# Altium project John_Main.PrjPcb (part 3 of 3)

## Sheet LED's Section_2.SchDoc
size A3; DocumentNumber: 5; SheetNumber: 5; SheetTotal: 7
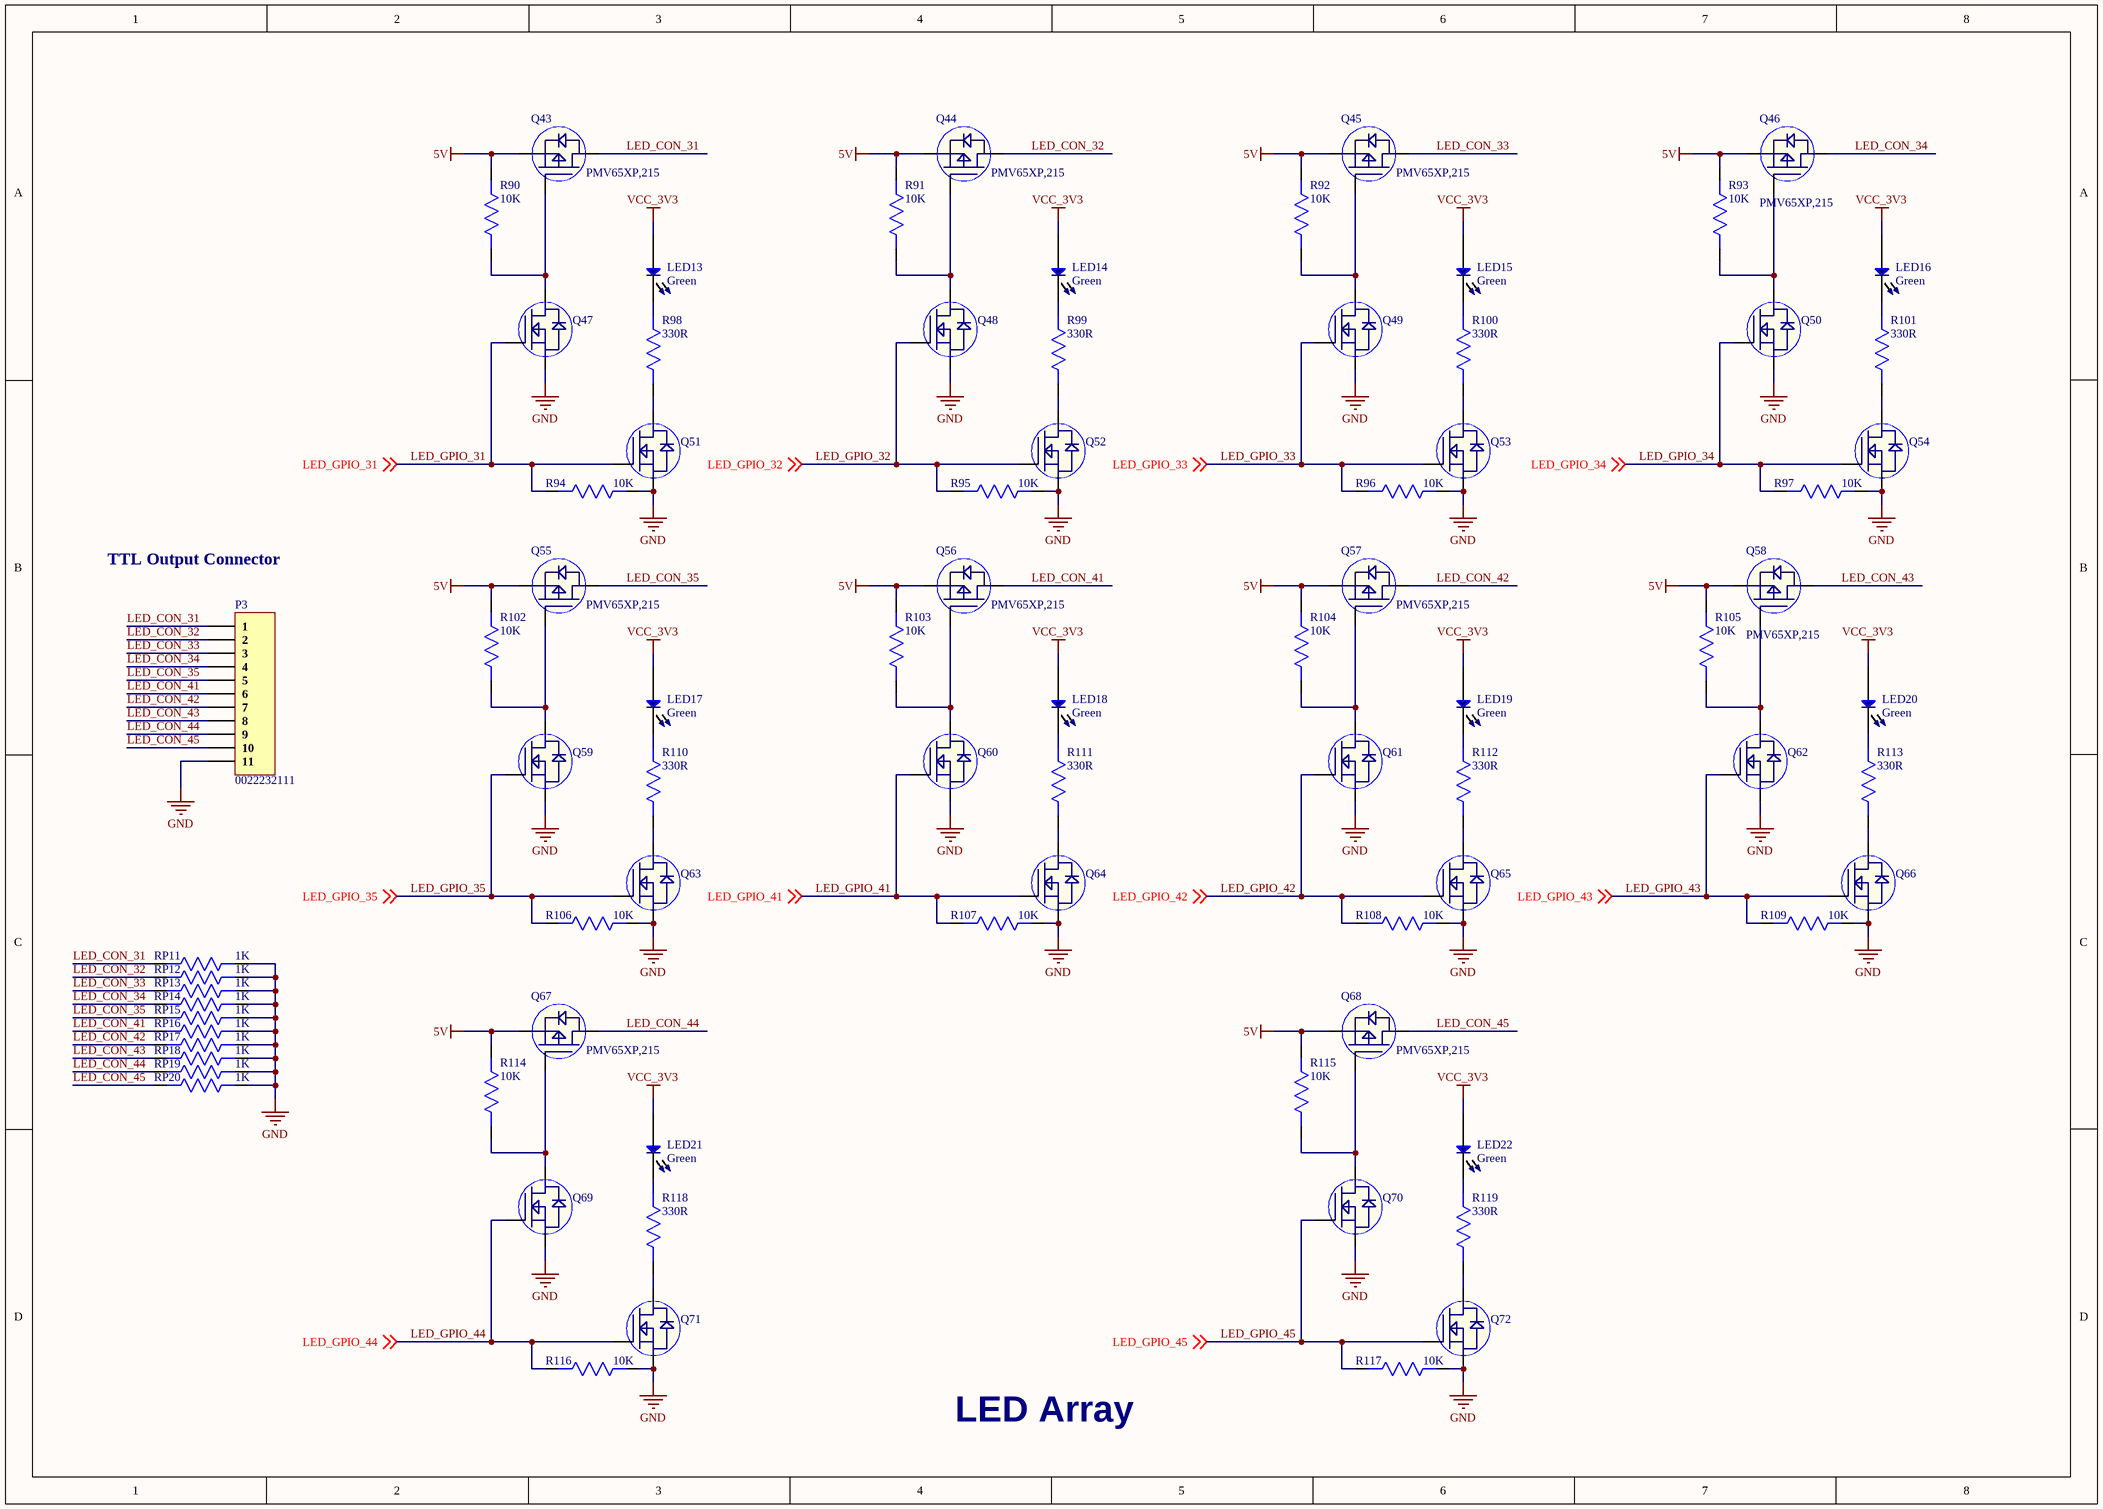
[diagram p4: LED's Section_2.SchDoc]

### Parts
LED13  Color: Green  [LED SMT]  (hidden comment: LTST-C190KGKT)
LED14  Color: Green  [LED SMT]  (hidden comment: LTST-C190KGKT)
LED15  Color: Green  [LED SMT]  (hidden comment: LTST-C190KGKT)
LED16  Color: Green  [LED SMT]  (hidden comment: LTST-C190KGKT)
LED17  Color: Green  [LED SMT]  (hidden comment: LTST-C190KGKT)
LED18  Color: Green  [LED SMT]  (hidden comment: LTST-C190KGKT)
LED19  Color: Green  [LED SMT]  (hidden comment: LTST-C190KGKT)
LED20  Color: Green  [LED SMT]  (hidden comment: LTST-C190KGKT)
LED21  Color: Green  [LED SMT]  (hidden comment: LTST-C190KGKT)
LED22  Color: Green  [LED SMT]  (hidden comment: LTST-C190KGKT)
P3  0022232111  [0022232111]
Q43  PMV65XP,215  [SOT23-3]
Q44  PMV65XP,215  [SOT23-3]
Q45  PMV65XP,215  [SOT23-3]
Q46  PMV65XP,215  [SOT23-3]
Q47  BSS138LT1G  [SOT23-3]  (value not drawn)
Q48  BSS138LT1G  [SOT23-3]  (value not drawn)
Q49  BSS138LT1G  [SOT23-3]  (value not drawn)
Q50  BSS138LT1G  [SOT23-3]  (value not drawn)
Q51  BSS138LT1G  [SOT23-3]  (value not drawn)
Q52  BSS138LT1G  [SOT23-3]  (value not drawn)
Q53  BSS138LT1G  [SOT23-3]  (value not drawn)
Q54  BSS138LT1G  [SOT23-3]  (value not drawn)
Q55  PMV65XP,215  [SOT23-3]
Q56  PMV65XP,215  [SOT23-3]
Q57  PMV65XP,215  [SOT23-3]
Q58  PMV65XP,215  [SOT23-3]
Q59  BSS138LT1G  [SOT23-3]  (value not drawn)
Q60  BSS138LT1G  [SOT23-3]  (value not drawn)
Q61  BSS138LT1G  [SOT23-3]  (value not drawn)
Q62  BSS138LT1G  [SOT23-3]  (value not drawn)
Q63  BSS138LT1G  [SOT23-3]  (value not drawn)
Q64  BSS138LT1G  [SOT23-3]  (value not drawn)
Q65  BSS138LT1G  [SOT23-3]  (value not drawn)
Q66  BSS138LT1G  [SOT23-3]  (value not drawn)
Q67  PMV65XP,215  [SOT23-3]
Q68  PMV65XP,215  [SOT23-3]
Q69  BSS138LT1G  [SOT23-3]  (value not drawn)
Q70  BSS138LT1G  [SOT23-3]  (value not drawn)
Q71  BSS138LT1G  [SOT23-3]  (value not drawn)
Q72  BSS138LT1G  [SOT23-3]  (value not drawn)
R90  10K  [Res0402]
R91  10K  [Res0402]
R92  10K  [Res0402]
R93  10K  [Res0402]
R94  10K  [Res0402]
R95  10K  [Res0402]
R96  10K  [Res0402]
R97  10K  [Res0402]
R98  330R  [Res0402]
R99  330R  [Res0402]
R100  330R  [Res0402]
R101  330R  [Res0402]
R102  10K  [Res0402]
R103  10K  [Res0402]
R104  10K  [Res0402]
R105  10K  [Res0402]
R106  10K  [Res0402]
R107  10K  [Res0402]
R108  10K  [Res0402]
R109  10K  [Res0402]
R110  330R  [Res0402]
R111  330R  [Res0402]
R112  330R  [Res0402]
R113  330R  [Res0402]
R114  10K  [Res0402]
R115  10K  [Res0402]
R116  10K  [Res0402]
R117  10K  [Res0402]
R118  330R  [Res0402]
R119  330R  [Res0402]
RP11  1K  [Res0402]
RP12  1K  [Res0402]
RP13  1K  [Res0402]
RP14  1K  [Res0402]
RP15  1K  [Res0402]
RP16  1K  [Res0402]
RP17  1K  [Res0402]
RP18  1K  [Res0402]
RP19  1K  [Res0402]
RP20  1K  [Res0402]

### Nets
5V: Q43.2(S) Q44.2(S) Q45.2(S) Q46.2(S) Q55.2(S) Q56.2(S) Q57.2(S) Q58.2(S) Q67.2(S) Q68.2(S) R90.2 R91.2 R92.2 R93.2 R102.2 R103.2 R104.2 R105.2 R114.2 R115.2
GND: P3.11 Q47.2(S) Q48.2(S) Q49.2(S) Q50.2(S) Q51.2(S) Q52.2(S) Q53.2(S) Q54.2(S) Q59.2(S) Q60.2(S) Q61.2(S) Q62.2(S) Q63.2(S) Q64.2(S) Q65.2(S) Q66.2(S) Q69.2(S) Q70.2(S) Q71.2(S) Q72.2(S) R94.2 R95.2 R96.2 R97.2 R106.2 R107.2 R108.2 R109.2 R116.2 R117.2 RP11.1 RP12.1 RP13.1 RP14.1 RP15.1 RP16.1 RP17.1 RP18.1 RP19.1 RP20.1
VCC_3V3: LED13.1 LED14.1 LED15.1 LED16.1 LED17.1 LED18.1 LED19.1 LED20.1 LED21.1 LED22.1
LED_CON_31: P3.1 Q43.3(D) RP11.2
LED_CON_32: P3.2 Q44.3(D) RP12.2
LED_CON_33: P3.3 Q45.3(D) RP13.2
LED_CON_34: P3.4 Q46.3(D) RP14.2
LED_CON_35: P3.5 Q55.3(D) RP15.2
LED_CON_41: P3.6 Q56.3(D) RP16.2
LED_CON_42: P3.7 Q57.3(D) RP17.2
LED_CON_43: P3.8 Q58.3(D) RP18.2
LED_CON_44: P3.9 Q67.3(D) RP19.2
LED_CON_45: P3.10 Q68.3(D) RP20.2
LED_GPIO_31: Q47.1(G) Q51.1(G) R94.1 ; off-sheet LED_GPIO_31
LED_GPIO_32: Q48.1(G) Q52.1(G) R95.1 ; off-sheet LED_GPIO_32
LED_GPIO_33: Q49.1(G) Q53.1(G) R96.1 ; off-sheet LED_GPIO_33
LED_GPIO_34: Q50.1(G) Q54.1(G) R97.1 ; off-sheet LED_GPIO_34
LED_GPIO_35: Q59.1(G) Q63.1(G) R106.1 ; off-sheet LED_GPIO_35
LED_GPIO_41: Q60.1(G) Q64.1(G) R107.1 ; off-sheet LED_GPIO_41
LED_GPIO_42: Q61.1(G) Q65.1(G) R108.1 ; off-sheet LED_GPIO_42
LED_GPIO_43: Q62.1(G) Q66.1(G) R109.1 ; off-sheet LED_GPIO_43
LED_GPIO_44: Q69.1(G) Q71.1(G) R116.1 ; off-sheet LED_GPIO_44
LED_GPIO_45: Q70.1(G) Q72.1(G) R117.1 ; off-sheet LED_GPIO_45
NetLED13_2: LED13.2 R98.1
NetLED14_2: LED14.2 R99.1
NetLED15_2: LED15.2 R100.1
NetLED16_2: LED16.2 R101.1
NetLED17_2: LED17.2 R110.1
NetLED18_2: LED18.2 R111.1
NetLED19_2: LED19.2 R112.1
NetLED20_2: LED20.2 R113.1
NetLED21_2: LED21.2 R118.1
NetLED22_2: LED22.2 R119.1
NetQ43_1: Q43.1(G) Q47.3(D) R90.1
NetQ44_1: Q44.1(G) Q48.3(D) R91.1
NetQ45_1: Q45.1(G) Q49.3(D) R92.1
NetQ46_1: Q46.1(G) Q50.3(D) R93.1
NetQ51_3: Q51.3(D) R98.2
NetQ52_3: Q52.3(D) R99.2
NetQ53_3: Q53.3(D) R100.2
NetQ54_3: Q54.3(D) R101.2
NetQ55_1: Q55.1(G) Q59.3(D) R102.1
NetQ56_1: Q56.1(G) Q60.3(D) R103.1
NetQ57_1: Q57.1(G) Q61.3(D) R104.1
NetQ58_1: Q58.1(G) Q62.3(D) R105.1
NetQ63_3: Q63.3(D) R110.2
NetQ64_3: Q64.3(D) R111.2
NetQ65_3: Q65.3(D) R112.2
NetQ66_3: Q66.3(D) R113.2
NetQ67_1: Q67.1(G) Q69.3(D) R114.1
NetQ68_1: Q68.1(G) Q70.3(D) R115.1
NetQ71_3: Q71.3(D) R118.2
NetQ72_3: Q72.3(D) R119.2

### Notes on the sheet
- TTL Output Connector
- LED Array

### Library data of the parts
LED13-LED22 = LTST-C190KGKT: LED GREEN CLEAR CHIP SMD; Manufacturer: Vishay Lite-On; Lens Color: Colorless; Lens Style: Diffused,Colorless,Rectangular,Clear; Forward Voltage: 2V; Luminous Intensity: 35mcd; Viewing Angle: 130°; Dominant Wavelength: 571nm; Test Current: 20mA; Wavelength: 574nm; Forward Current: 30mA; Power Rating: 75mW; Number of Elements: 1; Reverse Voltage: 5V; Supplier 1: Digi-Key; Manufacturer Part Number: LTST-C190KGKT; Stock 1: 1327387; Pricing 1: 1=0.26, 10=0.188, 25=0.138, 100=0.0987, 250=0.06712, 500=0.05922, 1000=0.04639 (USD); Mount: Surface Mount; Case/Package: 0603; Number of Pins: 2; Case Code (Metric): 1608; Case Code (Imperial): 0603; Min Operating Temperature: -55°C; Max Operating Temperature: 85°C; Packaging: Tape and Reel; Package Quantity: 1; Lens Transparency: Clear; Illumination Color: Green; Power Dissipation: 75mW; Number of LEDs: 1; Length: 1.6mm; Height: 0.8mm; Width: 0.8mm; Depth: 0.8mm; Radiation Hardening: No; Lead Free: Lead Free; ComponentLink1URL: https://www.verical.com/server-webapp/html/getDatasheet?partID=141494&src-supplier=Verical; ComponentLink1Description: https://www.verical.com/server-webapp/html/getDatasheet?partID=141494&src-supplier=Verical; ComponentLink2URL: http://optoelectronics.liteon.com/upload/download/DS22-2000-074/LTST-C190KGKT.PDF?src-supplier=Digi-Key; ComponentLink2Description: http://optoelectronics.liteon.com/upload/download/DS22-2000-074/LTST-C190KGKT.PDF?src-supplier=Digi-Key; ComponentLink3URL: http://www.mouser.com/ds/2/239/LTST-C190KGKT-1141861.pdf?src-supplier=Mouser; ComponentLink3Description: http://www.mouser.com/ds/2/239/LTST-C190KGKT-1141861.pdf?src-supplier=Mouser; ComponentLink4URL: http://uk.rs-online.com/webdocs/0dc0/0900766b80dc02a8.pdf?src-supplier=RSComponents; ComponentLink4Description: http://uk.rs-online.com/webdocs/0dc0/0900766b80dc02a8.pdf?src-supplier=RSComponents; Supplier Part Number 1: 160-1435-6-ND
P3 = 0022232111: CONN HEADER VERT 11POS 2.54MM; Manufacturer: Molex; Contact Resistance: 10mR; Number of Contacts: 11; Gender: Male; Supplier 1: Digi-Key; Manufacturer Part Number: 0022232111; Stock 1: 1529; Pricing 1: 1=0.74, 10=0.652, 100=0.5628, 500=0.46046, 1000=0.4093, 5000=0.35813, 10000=0.34023 (USD); Contact Plating: Copper,Tin; Contact Material: Brass; Housing Color: White; Housing Material: Nylon; Min Operating Temperature: 0°C; Max Operating Temperature: 75°C; Number of Rows: 1; Packaging: Bag; Termination: Solder; Orientation: Straight; Length: 27.94mm; Pitch: 2.54mm; Depth: 6.35mm; ComponentLink1URL: http://components.arrow.com/part/dataview/4703620S3674830N3303?src-supplier=Arrow; ComponentLink1Description: http://components.arrow.com/part/dataview/4703620S3674830N3303?src-supplier=Arrow; Supplier Part Number 1: 23-0022232111-ND
Q43-Q46 Q55-Q58 Q67 Q68 = PMV65XP,215: MOSFET P-CH 20V 2.8A SOT-23; Manufacturer: Nexperia; Supplier 1: Digi-Key; Manufacturer Part Number: PMV65XP,215; Stock 1: 60287; Pricing 1: 1=0.38, 10=0.28, 25=0.2452, 100=0.133, 250=0.13232, 500=0.1085, 1000=0.0805 (USD); Supplier Part Number 1: 1727-3124-1-ND
Q47-Q54 Q59-Q66 Q69-Q72 = BSS138LT1G: MOSFET N-CH 50V 200MA SOT-23; Manufacturer: ON Semiconductor; Gate to Source Voltage (Vgs): 20V; Nominal Vgs: 1.5V; Rds On Max: 3.5R; Input Capacitance: 50pF; Number of Elements: 1; Max Power Dissipation: 225mW; Turn-Off Delay Time: 20ns; Element Configuration: Single; ComponentLink1URL: https://datasheet.ciiva.com/22641/1596366-22641636.pdf; ComponentLink1Description: https://datasheet.ciiva.com/22641/1596366-22641636.pdf; ComponentLink2URL: https://datasheet.ciiva.com/1190/1596366-1190137.pdf; ComponentLink2Description: https://datasheet.ciiva.com/1190/1596366-1190137.pdf; ComponentLink3URL: https://datasheet.ciiva.com/15198/getdatasheetpartid-110266-15198908.pdf; ComponentLink3Description: https://datasheet.ciiva.com/15198/getdatasheetpartid-110266-15198908.pdf; ComponentLink4URL: https://datasheet.ciiva.com/8115/bss138lt1-d-8115295.pdf; ComponentLink4Description: https://datasheet.ciiva.com/8115/bss138lt1-d-8115295.pdf; ComponentLink5URL: https://datasheet.ciiva.com/8115/bss138lt1-d-8115358.pdf; ComponentLink5Description: https://datasheet.ciiva.com/8115/bss138lt1-d-8115358.pdf; ComponentLink6URL: https://datasheet.ciiva.com/1190/1596366-1190136.pdf; ComponentLink6Description: https://datasheet.ciiva.com/1190/1596366-1190136.pdf; ComponentLink7URL: https://datasheet.ciiva.com/936/bss138lt1-d-936802.pdf; ComponentLink7Description: https://datasheet.ciiva.com/936/bss138lt1-d-936802.pdf; ComponentLink8URL: https://datasheet.ciiva.com/936/bss138lt1-d-936801.pdf; ComponentLink8Description: https://datasheet.ciiva.com/936/bss138lt1-d-936801.pdf; ComponentLink9URL: https://datasheet.ciiva.com/14553/70099493-14553829.pdf; ComponentLink9Description: https://datasheet.ciiva.com/14553/70099493-14553829.pdf; ComponentLink10URL: https://datasheet.ciiva.com/936/bss138lt1-d-936803.pdf; ComponentLink10Description: https://datasheet.ciiva.com/936/bss138lt1-d-936803.pdf; Supplier 1: Digi-Key; Manufacturer Part Number: BSS138LT1G; Stock 1: 1283212; Pricing 1: 1=0.27, 10=0.222, 100=0.1177, 500=0.07746, 1000=0.05267 (USD); Case/Package: SOT-23-3; Number of Pins: 3; Contact Plating: Tin,Matte; Min Operating Temperature: -55°C; Max Operating Temperature: 150°C; Continuous Drain Current (ID): 200mA; Package Quantity: 1; Packaging: Tape and Reel; Drain to Source Breakdown Voltage: 50V; Power Dissipation: 225mW; Drain to Source Resistance: 3.5R; Threshold Voltage: 1.5V; Turn-On Delay Time: 20ns; Voltage Rating (DC): 50V; Current Rating: 200mA; On-State Resistance: 3.5R; Length: 3.04mm; Height: 1.01mm; Width: 1.4mm; Radiation Hardening: No; REACH SVHC: No SVHC; Lead Free: Lead Free; Halogen Free: Halogen Free; ComponentLink11URL: http://www.onsemi.com/pub/Collateral/BSS138LT1-D.PDF?src-supplier=Digi-Key; ComponentLink11Description: http://www.onsemi.com/pub/Collateral/BSS138LT1-D.PDF?src-supplier=Digi-Key; ComponentLink12URL: http://www.farnell.com/datasheets/1596366.pdf?src-supplier=Element14; ComponentLink12Description: http://www.farnell.com/datasheets/1596366.pdf?src-supplier=Element14; ComponentLink13URL: http://www.alliedelec.com/m/d/b3c6fd7d92596813fe75d33dcbaaae90.pdf?src-supplier=Allied+Electronics; ComponentLink13Description: http://www.alliedelec.com/m/d/b3c6fd7d92596813fe75d33dcbaaae90.pdf?src-supplier=Allied+Electronics; ComponentLink14URL: https://www.verical.com/server-webapp/html/getDatasheet?partID=110266&src-supplier=Verical; ComponentLink14Description: https://www.verical.com/server-webapp/html/getDatasheet?partID=110266&src-supplier=Verical; ComponentLink15URL: http://www.onsemi.com/pub_link/Collateral/BSS138LT1-D.PDF?src-supplier=Avnet; ComponentLink15Description: http://www.onsemi.com/pub_link/Collateral/BSS138LT1-D.PDF?src-supplier=Avnet; Supplier Part Number 1: BSS138LT1GOSDKR-ND
R90-R97 R102-R109 R114-R117 = RC0402FR-0710KL: RES SMD 10K OHM 1% 1/16W 0402; Manufacturer: Yageo Phycomp; Temperature Coefficient: 100ppm/°C; Resistance: 10000R; Voltage Rating (DC): 50V; Power Rating: 63mW; Supplier 1: Digi-Key; Manufacturer Part Number: RC0402FR-0710KL; Stock 1: 98435877; Pricing 1: 1=0.1, 10=0.016, 100=0.0067, 1000=0.00301, 2500=0.00261, 5000=0.00215 (USD); Mount: Surface Mount; Case/Package: 0402; Number of Pins: 2; Min Operating Temperature: -55°C; Max Operating Temperature: 155°C; Tolerance: 1%; Packaging: Cut Tape; Length: 1mm; Height: 0.32mm; Width: 500um; Depth: 0.5mm; REACH SVHC: No SVHC; Lead Free: Lead Free; Supplier Part Number 1: 311-10.0KLRCT-ND
R98-R101 R110-R113 R118 R119 = RC0402FR-07330RL: RES SMD 330 OHM 1% 1/16W 0402; Manufacturer: Yageo; Power Rating: 62.5mW; Voltage Rating: 50V; Temperature Coefficient: 100ppm/°C; Max Power Dissipation: 63mW; ComponentLink1URL: http://www.farnell.com/datasheets/1784430.pdf?src-supplier=Element14; ComponentLink1Description: http://www.farnell.com/datasheets/1784430.pdf?src-supplier=Element14; ComponentLink2URL: http://www.yageo.com/documents/recent/PYu-RC_Group_51_RoHS_L_9.pdf?src-supplier=Mouser; ComponentLink2Description: http://www.yageo.com/documents/recent/PYu-RC_Group_51_RoHS_L_9.pdf?src-supplier=Mouser; ComponentLink3URL: http://www.yageo.com/documents/recent/PYu-RC0402_51_RoHS_L_6_r.pdf?src-supplier=Future+Electronics; ComponentLink3Description: http://www.yageo.com/documents/recent/PYu-RC0402_51_RoHS_L_6_r.pdf?src-supplier=Future+Electronics; ComponentLink4URL: https://www.verical.com/server-webapp/html/getDatasheet?partID=329466&src-supplier=Verical; ComponentLink4Description: https://www.verical.com/server-webapp/html/getDatasheet?partID=329466&src-supplier=Verical; ComponentLink5URL: http://www.farnell.com/datasheets/1018594.pdf?src-supplier=Element14; ComponentLink5Description: http://www.farnell.com/datasheets/1018594.pdf?src-supplier=Element14; ComponentLink6URL: http://www.farnell.com/datasheets/2167052.pdf?src-supplier=Element14; ComponentLink6Description: http://www.farnell.com/datasheets/2167052.pdf?src-supplier=Element14; ComponentLink7URL: http://documents.rs-components.com/techlib://itc_doclist_GB.htm?stockno=6185810&src-supplier=RSComponents; ComponentLink7Description: http://documents.rs-components.com/techlib://itc_doclist_GB.htm?stockno=6185810&src-supplier=RSComponents; Supplier 1: Digi-Key; Manufacturer Part Number: RC0402FR-07330RL; Stock 1: 6258760; Pricing 1: 1=0.1, 10=0.016, 100=0.0067, 1000=0.003, 2500=0.0026, 5000=0.0022 (USD); Case/Package: 0402; Case Code (Metric): 1005; Case Code (Imperial): 0402; Min Operating Temperature: -55°C; Max Operating Temperature: 155°C; Packaging: Tape and Reel; Resistance: 330R; Tolerance: 1%; Composition: Thick Film; Termination: SMD/SMT; Military Standard: Not; Package Quantity: 1; Number of Terminations: 2; Features: Moisture Resistant; Length: 0.039inch; Height: 0.016inch; Depth: 0.5mm; Width: 0.02inch; REACH SVHC: Unknown; Lead Free: Lead Free; ComponentLink8URL: http://www.yageo.com/documents/recent/PYu-RC_Group_51_RoHS_L_10.pdf?src-supplier=Digi-Key; ComponentLink8Description: http://www.yageo.com/documents/recent/PYu-RC_Group_51_RoHS_L_10.pdf?src-supplier=Digi-Key; ComponentLink9URL: http://www.mouser.com/ds/2/447/PYu-RC0402_51_RoHS_L_6_r-8721.pdf?src-supplier=Mouser; ComponentLink9Description: http://www.mouser.com/ds/2/447/PYu-RC0402_51_RoHS_L_6_r-8721.pdf?src-supplier=Mouser; Supplier Part Number 1: 311-330LRCT-ND
RP11-RP20 = AT0402FRE071KL: RES SMD 1K OHM 1% 1/16W 0402; Manufacturer: Yageo; Resistance: 1kR; Max Power Dissipation: 63mW; Temperature Coefficient: 50ppm/°C; Supplier 1: Digi-Key; Manufacturer Part Number: AT0402FRE071KL; RoHS: Yes; Category: Chip SMD Resistors; Stock 1: 559; Pricing 1: 1=0.14000, 10=0.11800, 100=0.04620, 1000=0.01935, 2500=0.01774, 5000=0.01612 (USD); Case/Package: 0402; Case Code (Metric): 1005; Case Code (Imperial): 0402; Min Operating Temperature: -55°C; Max Operating Temperature: 155°C; Packaging: Tape and Reel; Resistor Type: Thin Film; Number of Terminations: 2; Tolerance: 1%; Features: Moisture Resistant,Automotive AEC-Q200,Anti-Sulfur; Length: 0.039inch; Width: 0.02inch; Height: 0.014inch; RoHS Compliant: Yes; ComponentLink1URL: http://www.yageo.com/documents/recent/PYu-AT_51_RoHS_L-3.pdf?src-supplier=Digi-Key; ComponentLink1Description: http://www.yageo.com/documents/recent/PYu-AT_51_RoHS_L-3.pdf?src-supplier=Digi-Key; ComponentLink2URL: http://www.yageo.com/documents/recent/PYu-AT_51_RoHS_L_5.pdf?src-supplier=Digi-Key; ComponentLink2Description: http://www.yageo.com/documents/recent/PYu-AT_51_RoHS_L_5.pdf?src-supplier=Digi-Key; Supplier Part Number 1: YAG2105CT-ND

## Sheet USB Section.SchDoc: *USB Section
size A4; DocumentNumber: 3; SheetNumber: 3; SheetTotal: 7
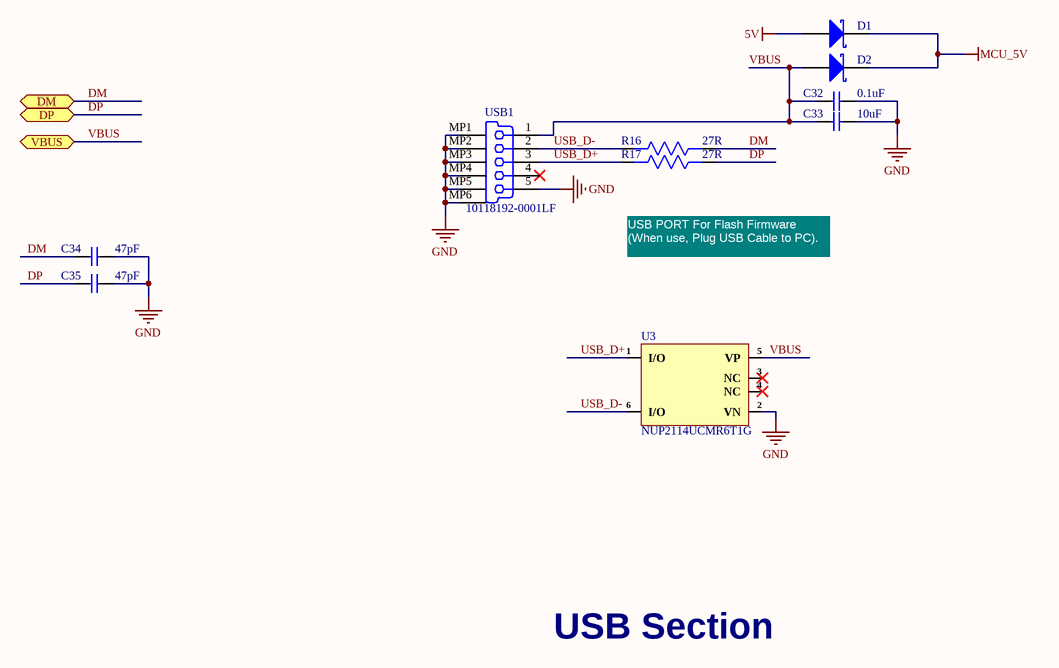
[diagram p5: USB Section.SchDoc]

### Parts
C32  0.1uF  [Cap0402]
C33  10uF  [Cap0402]
C34  47pF  [Cap0402]
C35  47pF  [Cap0402]
D1  PMEG3010ER,115  [SOD123W]  (value not drawn)
D2  PMEG3010ER,115  [SOD123W]  (value not drawn)
R16  27R  [Res0402]
R17  27R  [Res0402]
U3  NUP2114UCMR6T1G  [6-TSOP]
USB1  10118192-0001LF  [Micro Usb Conn SMD]

### Ports
DM (bidir), DP (bidir), VBUS (bidir)

### Nets
5V: D1.A
GND: C32.2 C33.2 C34.2 C35.2 U3.2(VN) USB1.5(GND) USB1.MP1(Tab) USB1.MP2(Tab) USB1.MP3(Tab) USB1.MP4(Tab) USB1.MP5(Tab) USB1.MP6(Tab)
MCU_5V: D1.K D2.K
VBUS: C32.1 C33.1 D2.A U3.5(VP) USB1.1(V_BUS_(5V)) ; port VBUS
DM: C34.1 R16.1 ; port DM
DP: C35.1 R17.1 ; port DP
USB_D+: R17.2 U3.1(I/O) USB1.3(D+)
USB_D-: R16.2 U3.6(I/O) USB1.2(D-)

Not connected (* = marked no-connect by the designer): U3 3(NC)* 4(NC)*; USB1 4(NC)*

### Notes on the sheet
- USB PORT For Flash Firmware
  (When use, Plug USB Cable to PC).
- USB Section

### Library data of the parts
C32 = CC0402KRX5R7BB104: CAP CER 0.1UF 16V X5R 0402; Manufacturer: Yageo; Capacitance: 100nF; Tolerance: 10%; Supplier 1: Digi-Key; Manufacturer Part Number: CC0402KRX5R7BB104; Stock 1: 2577166; Pricing 1: 1=0.1, 10=0.03, 100=0.0135, 500=0.0096, 1000=0.0076, 2500=0.0069, 5000=0.0063 (USD); Mount: Surface Mount; Case/Package: 0402; Number of Pins: 2; Case Code (Metric): 1005; Case Code (Imperial): 0402; Min Operating Temperature: -55°C; Max Operating Temperature: 85°C; Packaging: Tape and Reel; Voltage Rating: 16V; Package Quantity: 1; Voltage Rating (DC): 16V; Dielectric: X5R; Termination: SMD/SMT; Composition: Ceramic; Length: 1mm; Height: 0.5mm; Width: 0.02inch; Thickness: 0.022inch; Depth: 0.5mm; Radiation Hardening: No; REACH SVHC: Unknown; Lead Free: Lead Free; Halogen Free: Halogen Free; ComponentLink1URL: http://www.yageo.com/documents/recent/UPY-GPHC_X5R_4V-to-50V_12.pdf?src-supplier=Avnet; ComponentLink1Description: http://www.yageo.com/documents/recent/UPY-GPHC_X5R_4V-to-50V_12.pdf?src-supplier=Avnet; ComponentLink2URL: http://www.yageo.com/documents/recent/UPY-GPHC_X5R_4V-to-50V_25.pdf?src-supplier=Digi-Key; ComponentLink2Description: http://www.yageo.com/documents/recent/UPY-GPHC_X5R_4V-to-50V_25.pdf?src-supplier=Digi-Key; ComponentLink3URL: http://www.yageo.com/exep/pages/download/literatures/ProductSelectionGuide%202014_Final_2.pdf?src-supplier=Digi-Key; ComponentLink3Description: http://www.yageo.com/exep/pages/download/literatures/ProductSelectionGuide%202014_Final_2.pdf?src-supplier=Digi-Key; ComponentLink4URL: http://www.yageo.com/documents/recent/UPY-GPHC_X5R_4V-to-50V_12.pdf?src-supplier=Avnet+Europe; ComponentLink4Description: http://www.yageo.com/documents/recent/UPY-GPHC_X5R_4V-to-50V_12.pdf?src-supplier=Avnet+Europe; Supplier Part Number 1: 311-1347-1-ND
C33 = CL05A106MP8NUB8: CAP CER 10UF 10V X5R 0402; Manufacturer: Samsung; Tolerance: 20%; Supplier 1: Digi-Key; Manufacturer Part Number: CL05A106MP8NUB8; Stock 1: 1158256; Pricing 1: 1=0.45, 10=0.311, 100=0.1863, 500=0.13972, 1000=0.11799, 2500=0.11178 (USD); Mount: Surface Mount; Case/Package: 0402; Case Code (Metric): 1005; Case Code (Imperial): 0402; Min Operating Temperature: -55°C; Max Operating Temperature: 85°C; Packaging: Tape and Reel; Capacitance: 10uF; Voltage Rating: 10V; Length: 0.039inch; Width: 0.02inch; Thickness: 0.035inch; Supplier Part Number 1: 1276-6830-1-ND
C34 C35 = GCM1555C1H470JA16D: CAP CER 47PF 50V C0G/NP0 0402; Manufacturer: Murata; Tolerance: 5%; Supplier 1: Digi-Key; Manufacturer Part Number 1: GCM1555C1H470JA16D; Stock 1: 524245; Pricing 1: 1=0.1, 10=0.068, 100=0.0303, 500=0.0217, 1000=0.017, 2500=0.0155, 5000=0.0142 (USD); Mount: Surface Mount; Case/Package: 0402; Case Code (Metric): 1005; Case Code (Imperial): 0402; Min Operating Temperature: -55°C; Max Operating Temperature: 125°C; Packaging: Cut Tape; Capacitance: 47pF; Voltage Rating: 50V; Length: 0.039inch; Width: 0.02inch; Thickness: 0.022inch; Ratings: AEC-Q200; Lead Free: Lead Free; Supplier Part Number 1: 490-10670-1-ND
D1 D2 = PMEG3010ER,115: DIODE SCHOTTKY 30V 1A SOD123W; Manufacturer: Nexperia; Supplier 1: Digi-Key; Manufacturer Part Number: PMEG3010ER,115; Stock 1: 75070; Pricing 1: 1=0.36, 10=0.29, 100=0.1669, 500=0.1545, 1000=0.10506 (USD); Supplier Part Number 1: 1727-5201-1-ND
R16 R17 = RT0402FRE0727RL: RES SMD 27 OHM 1% 1/16W 0402; Manufacturer: Yageo; Power Rating: 62.5mW; Voltage Rating: 50V; Max Power Dissipation: 63mW; Temperature Coefficient: 50ppm/°C; Supplier 1: Digi-Key; Manufacturer Part Number 1: RT0402FRE0727RL; Stock 1: 26946; Pricing 1: 1=0.1, 10=0.072, 100=0.0277, 1000=0.0122, 2500=0.0105, 5000=0.0094 (USD); Case/Package: 0402; Case Code (Metric): 1005; Case Code (Imperial): 0402; Min Operating Temperature: -55°C; Max Operating Temperature: 125°C; Resistance: 27R; Tolerance: 1%; Packaging: Tape and Reel; Package Quantity: 10000; Composition: Thin Film; Number of Terminations: 2; Termination: SMD/SMT; Military Standard: Not; Voltage Rating (DC): 50V; Features: Moisture Resistant; Length: 1mm; Height: 0.014inch; Width: 0.02inch; Depth: 0.5mm; Lead Free: Lead Free; ComponentLink1URL: http://www.yageo.com/NewPortal/yageodocoutput?fileName=/pdf/R-Chip/PYu-RT_1-to-0.05_RoHS_L_5.pdf&src-supplier=Digi-Key; ComponentLink1Description: http://www.yageo.com/NewPortal/yageodocoutput?fileName=/pdf/R-Chip/PYu-RT_1-to-0.05_RoHS_L_5.pdf&src-supplier=Digi-Key; ComponentLink2URL: http://www.mouser.com/ds/2/447/yageodocoutput-1125656.pdf?src-supplier=Mouser; ComponentLink2Description: http://www.mouser.com/ds/2/447/yageodocoutput-1125656.pdf?src-supplier=Mouser; Supplier Part Number 1: YAG3343CT-ND
U3 = NUP2114UCMR6T1G: TVS DIODE 5VWM 10VC 6TSOP; Manufacturer: onsemi; Manufacturer Lifecycle Status: ACTIVE; Item Type: TVS Diodes; Breakdown Voltage: 7.5V; Value: 1pF; Clamping Voltage: 12V; Direction: Unidirectional; Element Configuration: Single; ESD Protection: Yes; Leakage Current: 1µA; Max Surge Current: 19A; Min Breakdown Voltage: 6V; Number of Bidirectional Channels: 2; Number of Channels: 1; Operating Supply Voltage: 5V; Peak Pulse Current: 8A; Test Current: 1mA; Supplier: DigiKey; LCSC Part Number: C393373; Manufacturer Part Number: NUP2114UCMR6T1G; RoHS: Compliant; Stock: 34630; Pricing: 1=0.81, 10=0.5, 100=0.3234, 500=0.24708, 1000=0.22246 (USD); Case/Package: TSOP; China RoHS: Compliant; Contact Plating: Tin; Depth: 1.5mm; Halogen Free: Halogen Free; Height: 1mm; Lead Free: Lead Free; Length: 3mm; Lifecycle Status: Production; Max Breakdown Voltage: 7.5V; Max Operating Temperature: 125°C; Max Reverse Leakage Current: 1µA; Min Operating Temperature: -40°C; Number of Elements: 1; Number of Lines: 2; Pins: 6; Number of Terminals: 6; Packaging: Tape and Reel; Peak Reverse Current: 1µA; Polarity: Unidirectional; Power Line Protection: Yes; Radiation Hardening: No; REACH SVHC: Yes; Reverse Standoff Voltage: 5V; Schedule B: 8536300000, 8536300000|8536300000|8536300000|8536300000|8536300000|8536300000|8536300000|8536300000|8536300000|8536300000|8536300000|8536300000|8536300000|8536300000|8536300000|8536300000|8536300000|8536300000|8536300000|8536300000|8536300000|8536300000|8536300000|85; Width: 1.7mm; Working Voltage: 5V; ComponentLink1URL: https://datasheet.octopart.com:443/NUP2114UCMR6T1G-onsemi-datasheet-180968601.pdf?src-supplier=IHS; ComponentLink1Description: https://datasheet.octopart.com:443/NUP2114UCMR6T1G-onsemi-datasheet-180968601.pdf?src-supplier=IHS; ComponentLink2URL: https://datasheet.octopart.com:443/NUP2114UCMR6T1G-ON-Semiconductor-datasheet-139013348.pdf?src-supplier=Upverter; ComponentLink2Description: https://datasheet.octopart.com:443/NUP2114UCMR6T1G-ON-Semiconductor-datasheet-139013348.pdf?src-supplier=Upverter; ComponentLink3URL: https://datasheet.octopart.com:443/NUP2114UCMR6T1G-ON-Semiconductor-datasheet-12517220.pdf?src-supplier=JRH+Electronics; ComponentLink3Description: https://datasheet.octopart.com:443/NUP2114UCMR6T1G-ON-Semiconductor-datasheet-12517220.pdf?src-supplier=JRH+Electronics; ComponentLink4URL: https://datasheet.octopart.com:443/NUP2114UCMR6T1G-ON-Semiconductor-datasheet-93402670.pdf?src-supplier=Newark; ComponentLink4Description: https://datasheet.octopart.com:443/NUP2114UCMR6T1G-ON-Semiconductor-datasheet-93402670.pdf?src-supplier=Newark; ComponentLink5URL: https://datasheet.octopart.com:443/NUP2114UCMR6T1G-ON-Semiconductor-datasheet-11781058.pdf?src-supplier=Arrow+Electronics; ComponentLink5Description: https://datasheet.octopart.com:443/NUP2114UCMR6T1G-ON-Semiconductor-datasheet-11781058.pdf?src-supplier=Arrow+Electronics; ComponentLink6URL: http://sigma.octopart.com:80/15540786/rohs_certificate/ON-Semiconductor-NUP2114UCMR6T1G.pdf?src-supplier=Compliance+Statements; ComponentLink6Description: http://sigma.octopart.com:80/15540786/rohs_certificate/ON-Semiconductor-NUP2114UCMR6T1G.pdf?src-supplier=Compliance+Statements; ComponentLink7URL: http://sigma.octopart.com:80/15684254/materials_sheet/ON-Semiconductor-NUP2114UCMR6T1G.csv?src-supplier=Compliance+Statements; ComponentLink7Description: http://sigma.octopart.com:80/15684254/materials_sheet/ON-Semiconductor-NUP2114UCMR6T1G.csv?src-supplier=Compliance+Statements; ComponentLink8URL: http://sigma.octopart.com:80/150629776/rohs_statement/ON-Semiconductor-NUP2114UCMR6T1G.pdf?src-supplier=Compliance+Statements; ComponentLink8Description: http://sigma.octopart.com:80/150629776/rohs_statement/ON-Semiconductor-NUP2114UCMR6T1G.pdf?src-supplier=Compliance+Statements; ComponentLink9URL: http://sigma.octopart.com:80/reach_statement/ON-Semiconductor-company-79.pdf?src-supplier=Compliance+Statements; ComponentLink9Description: http://sigma.octopart.com:80/reach_statement/ON-Semiconductor-company-79.pdf?src-supplier=Compliance+Statements; ComponentLink10URL: https://octopart.com:443/opatz8j6/c1?t=WHQR9uYdgpzj_1pscu76jQl6SgdNYEFCsB45f32wZZoFxCsQNnTKjjNsMYmP8-tNAzH3PllWfDzCrm21sm3O0yX6Z-53NNC5eFJr5XbJGHdORXd5PF3OOo3CImUBKNeQS3HmN9uPOWjBWXFdunIc45LQOJ5gn3633PacQX-_VlsFFggQuFkNQdU_reWhDfM_aJjhbu9NdAkiBle4rEQKmYnaoI-ZpXvRqCCi0hGZ9pE0dY1iMvStjDVJm3RbKYgavDmI8RSqtgWwHOO5VIrlYvErgV0U4ccu7WiifKCK2DwQWrnPYcBzCgFR9XOWz9r3-48fB14U1Lqb5JaFbo5XHNFFjMaufSDK6ZmMxG1n87oH0pc&src-supplier=Compliance+Statements; ComponentLink10Description: https://octopart.com:443/opatz8j6/c1?t=WHQR9uYdgpzj_1pscu76jQl6SgdNYEFCsB45f32wZZoFxCsQNnTKjjNsMYmP8-tNAzH3PllWfDzCrm21sm3O0yX6Z-53NNC5eFJr5XbJGHdORXd5PF3OOo3CImUBKNeQS3HmN9uPOWjBWXFdunIc45LQOJ5gn3633PacQX-_VlsFFggQuFkNQdU_reWhDfM_aJjhbu9NdAkiBle4rEQKmYnaoI-ZpXvRqCCi0hGZ9pE0dY1iMvStjDVJm3RbKYgavDmI8RSqtgWwHOO5VIrlYvErgV0U4ccu7WiifKCK2DwQWrnPYcBzCgFR9XOWz9r3-48fB14U1Lqb5JaFbo5XHNFFjMaufSDK6ZmMxG1n87oH0pc&src-supplier=Compliance+Statements; ComponentLink11URL: https://octopart.com:443/opatz8j6/c1?t=VqVTyc6VXqTBoXsnuoG7LjY3mp2KX-eKzPIkg7aySNunBFpm0IQnkmc826qVFZhglS6vaf-VvqwaWaROfS_iErSVq9YUUuVgokCDv5Vhxq2pu1cn-vrRw1TlcFDaGbodQB-atNY6UP6gD2sOO8NRAoQTemD37mLChF1Rt1bpz95WWhJ_wI0XqbdDN8V1Apvbq8ufNLXwMMdHk5jYglIDCz4WpJf5DoTt1BP_MBv-tXAye_NcKa095654jMt3sjm_6RuC2vVrkcCpfXNjjgvjYPsYUvKBiXeM6Xjzw9honyCE0JlgCVT7WXyyf_6oP9kIrOXlSICGvfIO1US9YbBHujA-CLkGpoYI906K6Xw-TlpUog&src-supplier=Compliance+Statements; ComponentLink11Description: https://octopart.com:443/opatz8j6/c1?t=VqVTyc6VXqTBoXsnuoG7LjY3mp2KX-eKzPIkg7aySNunBFpm0IQnkmc826qVFZhglS6vaf-VvqwaWaROfS_iErSVq9YUUuVgokCDv5Vhxq2pu1cn-vrRw1TlcFDaGbodQB-atNY6UP6gD2sOO8NRAoQTemD37mLChF1Rt1bpz95WWhJ_wI0XqbdDN8V1Apvbq8ufNLXwMMdHk5jYglIDCz4WpJf5DoTt1BP_MBv-tXAye_NcKa095654jMt3sjm_6RuC2vVrkcCpfXNjjgvjYPsYUvKBiXeM6Xjzw9honyCE0JlgCVT7WXyyf_6oP9kIrOXlSICGvfIO1US9YbBHujA-CLkGpoYI906K6Xw-TlpUog&src-supplier=Compliance+Statements
USB1 = Micro Usb Conn SMD: CONN USB MICRO B RECPT SMT R/A; Manufacturer: Amphenol FCI; Gender: Receptacle; Current Rating: 1.8A; Connector Type: USB,Receptacle; Number of Contacts: 5; Insulation Resistance: 1GR; Number of Ports: 1; Max Voltage Rating (AC): 100V; USB Standard: USB 2.0; Pitch: 0.65mm; Supplier 1: Digi-Key; Manufacturer Part Number: 10118192-0001LF; Stock 1: 203283; Pricing 1: 1=0.42, 10=0.393, 25=0.3536, 50=0.3144, 100=0.3013, 250=0.2751, 500=0.262 (USD); Mount: Surface Mount,Horizontal; Contact Material: Copper Alloy; Contact Plating: Nickel,Gold; Colour: Black; Number of Terminals: 5; Housing Material: Polymer; Min Operating Temperature: -55°C; Max Operating Temperature: 85°C; Termination: Solder; Orientation: Right Angle; Packaging: Tape and Reel; Package Quantity: 1400; Voltage Rating: 100V; Length: 7.86mm; Depth: 5.57mm; Radiation Hardening: No; Lead Free: Lead Free; Flammability Rating: UL94 V-0; REACH SVHC: No SVHC; ComponentLink1URL: https://datasheet.ciiva.com/26853/getdatasheetpartid-418041-26853891.pdf; ComponentLink1Description: https://datasheet.ciiva.com/26853/getdatasheetpartid-418041-26853891.pdf; ComponentLink2URL: https://datasheet.ciiva.com/851/10118192-851112.pdf; ComponentLink2Description: https://datasheet.ciiva.com/851/10118192-851112.pdf; ComponentLink3URL: https://datasheet.ciiva.com/4598/10118192ac-197249-4598796.pdf; ComponentLink3Description: https://datasheet.ciiva.com/4598/10118192ac-197249-4598796.pdf; Supplier Part Number 1: 609-4613-1-ND

## Sheet Connector Section.SchDoc
size A4; Engineer: *Mars; DocumentNumber: 7; SheetNumber: 7; SheetTotal: 7
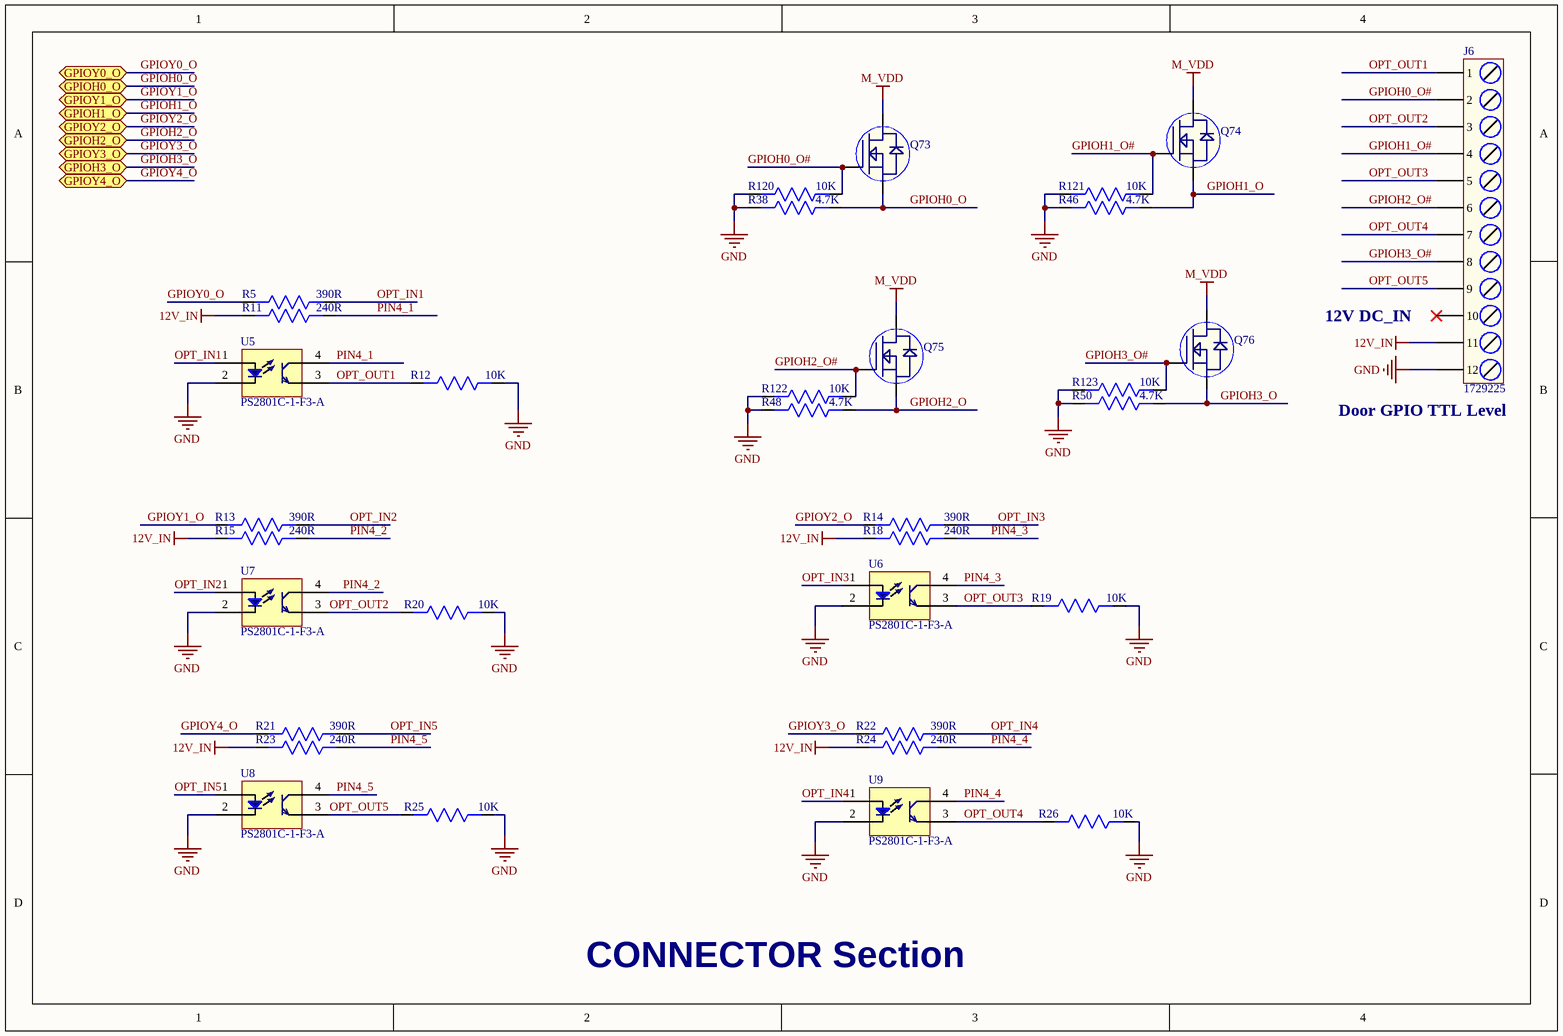
[diagram p6: Connector Section.SchDoc]

### Parts
J6  1729225  [Terminal Block 12 Pin]
Q73  BSS138LT1G  [SOT23-3]  (value not drawn)
Q74  BSS138LT1G  [SOT23-3]  (value not drawn)
Q75  BSS138LT1G  [SOT23-3]  (value not drawn)
Q76  BSS138LT1G  [SOT23-3]  (value not drawn)
R5  390R  [Res0603]
R11  240R  [Res0402]
R12  10K  [Res0402]
R13  390R  [Res0603]
R14  390R  [Res0603]
R15  240R  [Res0402]
R18  240R  [Res0402]
R19  10K  [Res0402]
R20  10K  [Res0402]
R21  390R  [Res0603]
R22  390R  [Res0603]
R23  240R  [Res0402]
R24  240R  [Res0402]
R25  10K  [Res0402]
R26  10K  [Res0402]
R38  4.7K  [Res0402]
R46  4.7K  [Res0402]
R48  4.7K  [Res0402]
R50  4.7K  [Res0402]
R120  10K  [Res0402]
R121  10K  [Res0402]
R122  10K  [Res0402]
R123  10K  [Res0402]
U5  PS2801C-1-F3-A  [PS2801C-1-F3-A]
U6  PS2801C-1-F3-A  [PS2801C-1-F3-A]
U7  PS2801C-1-F3-A  [PS2801C-1-F3-A]
U8  PS2801C-1-F3-A  [PS2801C-1-F3-A]
U9  PS2801C-1-F3-A  [PS2801C-1-F3-A]

### Ports
GPIOH0_O (bidir), GPIOH1_O (bidir), GPIOH2_O (bidir), GPIOH3_O (bidir), GPIOY0_O (bidir), GPIOY1_O (bidir), GPIOY2_O (bidir), GPIOY3_O (bidir), GPIOY4_O (bidir)

### Nets
12V_IN: J6.11 R11.2 R15.2 R18.2 R23.2 R24.2
GND: J6.12 R12.1 R19.1 R20.1 R25.1 R26.1 R38.1 R46.1 R48.1 R50.1 R120.2 R121.2 R122.2 R123.2 U5.2(Ca) U6.2(Ca) U7.2(Ca) U8.2(Ca) U9.2(Ca)
M_VDD: Q73.3(D) Q74.3(D) Q75.3(D) Q76.3(D)
GPIOH0_O: Q73.2(S) R38.2 ; port GPIOH0_O
GPIOH0_O#: J6.2 Q73.1(G) R120.1
GPIOH1_O: Q74.2(S) R46.2 ; port GPIOH1_O
GPIOH1_O#: J6.4 Q74.1(G) R121.1
GPIOH2_O: Q75.2(S) R48.2 ; port GPIOH2_O
GPIOH2_O#: J6.6 Q75.1(G) R122.1
GPIOH3_O: Q76.2(S) R50.2 ; port GPIOH3_O
GPIOH3_O#: J6.8 Q76.1(G) R123.1
GPIOY0_O: R5.2 ; port GPIOY0_O
GPIOY1_O: R13.2 ; port GPIOY1_O
GPIOY2_O: R14.2 ; port GPIOY2_O
GPIOY3_O: R22.2 ; port GPIOY3_O
GPIOY4_O: R21.2 ; port GPIOY4_O
OPT_IN1: R5.1 U5.1(An)
OPT_IN2: R13.1 U7.1(An)
OPT_IN3: R14.1 U6.1(An)
OPT_IN4: R22.1 U9.1(An)
OPT_IN5: R21.1 U8.1(An)
OPT_OUT1: J6.1 R12.2 U5.3(E)
OPT_OUT2: J6.3 R20.2 U7.3(E)
OPT_OUT3: J6.5 R19.2 U6.3(E)
OPT_OUT4: J6.7 R26.2 U9.3(E)
OPT_OUT5: J6.9 R25.2 U8.3(E)
PIN4_1: R11.1 U5.4(C)
PIN4_2: R15.1 U7.4(C)
PIN4_3: R18.1 U6.4(C)
PIN4_4: R24.1 U9.4(C)
PIN4_5: R23.1 U8.4(C)

Not connected (* = marked no-connect by the designer): J6 10*

### Notes on the sheet
- 12V DC_IN
- (near J6) Door GPIO TTL Level
- CONNECTOR Section

### Library data of the parts
J6 = Terminal Block 12 Pin: TERM BLK 12P SIDE ENT 5.08MM PCB; Manufacturer: Phoenix Contact; Number of Positions: 12; Connector Type: Screw; Current Rating: 13.5A; Voltage Rating: 400V; Max Supply Voltage: 250V; Number of Levels: 1; Current: 10A; Voltage: 300V; Wire Gauge (Max): 30AWG; Wire Gauge (Min): 14AWG; Stripping Length: 6mm; Approvals: UL,CSA,cULus,CB; Supplier 1: Digi-Key; Manufacturer Part Number: 1729225; Stock 1: 916; Pricing 1: 1=6.06, 10=5.898, 50=5.5126, 100=5.0715, 250=4.68564, 500=4.46518, 1000=4.18954 (USD); Mount: Through Hole; Number of Pins: 12; Weight: 1oz; Contact Material: Tin; Housing Color: Green; Housing Material: Polyamide; Color: Green; Insulation Material: Nylon; Package Quantity: 50; Packaging: Bulk; Number of Contacts: 12; Number of Rows: 1; Termination: Screw; Max Current Rating: 13.5A; Number of Poles: 12; Number of Positions Per Level: 12; Number of Circuits: 12; Orientation: Straight; Length: 60.96mm; Height: 13.5mm; Width: 60.96mm; Pitch: 5.08mm; Depth: 8.1mm; Lead Free: Lead Free; Flammability Rating: UL94 V-0; ComponentLink1URL: https://media.digikey.com/pdf/Data%20Sheets/Phoenix%20Contact%20PDFs/1729225.pdf?src-supplier=Digi-Key; ComponentLink1Description: https://media.digikey.com/pdf/Data%20Sheets/Phoenix%20Contact%20PDFs/1729225.pdf?src-supplier=Digi-Key; Supplier Part Number 1: 277-1257-ND
Q73-Q76 = BSS138LT1G: as Q47 on sheet LED's Section_2; ComponentLink1URL: https://datasheet.ciiva.com/22641/1596366-22641636.pdf; ComponentLink1Description: https://datasheet.ciiva.com/22641/1596366-22641636.pdf; ComponentLink2URL: https://datasheet.ciiva.com/1190/1596366-1190137.pdf; ComponentLink2Description: https://datasheet.ciiva.com/1190/1596366-1190137.pdf; ComponentLink3URL: https://datasheet.ciiva.com/15198/getdatasheetpartid-110266-15198908.pdf; ComponentLink3Description: https://datasheet.ciiva.com/15198/getdatasheetpartid-110266-15198908.pdf; ComponentLink4URL: https://datasheet.ciiva.com/8115/bss138lt1-d-8115295.pdf; ComponentLink4Description: https://datasheet.ciiva.com/8115/bss138lt1-d-8115295.pdf; ComponentLink5URL: https://datasheet.ciiva.com/8115/bss138lt1-d-8115358.pdf; ComponentLink5Description: https://datasheet.ciiva.com/8115/bss138lt1-d-8115358.pdf; ComponentLink6URL: https://datasheet.ciiva.com/1190/1596366-1190136.pdf; ComponentLink6Description: https://datasheet.ciiva.com/1190/1596366-1190136.pdf; ComponentLink7URL: https://datasheet.ciiva.com/936/bss138lt1-d-936802.pdf; ComponentLink7Description: https://datasheet.ciiva.com/936/bss138lt1-d-936802.pdf; ComponentLink8URL: https://datasheet.ciiva.com/936/bss138lt1-d-936801.pdf; ComponentLink8Description: https://datasheet.ciiva.com/936/bss138lt1-d-936801.pdf; ComponentLink9URL: https://datasheet.ciiva.com/14553/70099493-14553829.pdf; ComponentLink9Description: https://datasheet.ciiva.com/14553/70099493-14553829.pdf; ComponentLink10URL: https://datasheet.ciiva.com/936/bss138lt1-d-936803.pdf; ComponentLink10Description: https://datasheet.ciiva.com/936/bss138lt1-d-936803.pdf; Supplier 1: Digi-Key; Manufacturer Part Number: BSS138LT1G; Stock 1: 1283212; Pricing 1: 1=0.27, 10=0.222, 100=0.1177, 500=0.07746, 1000=0.05267 (USD); Case/Package: SOT-23-3; Number of Pins: 3; Contact Plating: Tin,Matte; Min Operating Temperature: -55°C; Max Operating Temperature: 150°C; Continuous Drain Current (ID): 200mA; Package Quantity: 1; Packaging: Tape and Reel; Drain to Source Breakdown Voltage: 50V; Power Dissipation: 225mW; Drain to Source Resistance: 3.5R; Threshold Voltage: 1.5V; Turn-On Delay Time: 20ns; Voltage Rating (DC): 50V; Current Rating: 200mA; On-State Resistance: 3.5R; Length: 3.04mm; Height: 1.01mm; Width: 1.4mm; Radiation Hardening: No; REACH SVHC: No SVHC; Lead Free: Lead Free; Halogen Free: Halogen Free; ComponentLink11URL: http://www.onsemi.com/pub/Collateral/BSS138LT1-D.PDF?src-supplier=Digi-Key; ComponentLink11Description: http://www.onsemi.com/pub/Collateral/BSS138LT1-D.PDF?src-supplier=Digi-Key; ComponentLink12URL: http://www.farnell.com/datasheets/1596366.pdf?src-supplier=Element14; ComponentLink12Description: http://www.farnell.com/datasheets/1596366.pdf?src-supplier=Element14; ComponentLink13URL: http://www.alliedelec.com/m/d/b3c6fd7d92596813fe75d33dcbaaae90.pdf?src-supplier=Allied+Electronics; ComponentLink13Description: http://www.alliedelec.com/m/d/b3c6fd7d92596813fe75d33dcbaaae90.pdf?src-supplier=Allied+Electronics; ComponentLink14URL: https://www.verical.com/server-webapp/html/getDatasheet?partID=110266&src-supplier=Verical; ComponentLink14Description: https://www.verical.com/server-webapp/html/getDatasheet?partID=110266&src-supplier=Verical; ComponentLink15URL: http://www.onsemi.com/pub_link/Collateral/BSS138LT1-D.PDF?src-supplier=Avnet; ComponentLink15Description: http://www.onsemi.com/pub_link/Collateral/BSS138LT1-D.PDF?src-supplier=Avnet; Supplier Part Number 1: BSS138LT1GOSDKR-ND
R5 R13 R14 R21 R22 = RC0603JR-07390RL: RES SMD 390 OHM 5% 1/10W 0603; Manufacturer: Yageo; Voltage Rating: 50V; Power Rating: 100mW; Temperature Coefficient: 100ppm/°C; Working Voltage: 75V; Supplier 1: Digi-Key; Manufacturer Part Number: RC0603JR-07390RL; Stock 1: 1598874; Pricing 1: 1=0.1, 10=0.02, 100=0.0081, 1000=0.00362, 2500=0.00314 (USD); Case/Package: 0603; Number of Pins: 2; Case Code (Imperial): 0603; Case Code (Metric): 1608; Min Operating Temperature: -55°C; Max Operating Temperature: 155°C; Voltage Rating (DC): 50V; Resistance: 390R; Tolerance: 5%; Packaging: Tape and Reel; Package Quantity: 1; Termination: SMD/SMT; Composition: Thick Film; Number of Terminations: 2; Military Standard: Not; Max Power Dissipation: 100mW; Features: Moisture Resistant; Length: 1.6mm; Height: 0.022inch; Width: 0.8mm; Depth: 0.8mm; REACH SVHC: No SVHC; Lead Free: Lead Free; ComponentLink1URL: http://www.yageo.com.tw/exep/pages/download/literatures/PYu-R_INT-thick_7.pdf?src-supplier=Digi-Key; ComponentLink1Description: http://www.yageo.com.tw/exep/pages/download/literatures/PYu-R_INT-thick_7.pdf?src-supplier=Digi-Key; ComponentLink2URL: http://www.yageo.com/documents/recent/PYu-RC_Group_51_RoHS_L_10.pdf?src-supplier=Digi-Key; ComponentLink2Description: http://www.yageo.com/documents/recent/PYu-RC_Group_51_RoHS_L_10.pdf?src-supplier=Digi-Key; ComponentLink3URL: http://www.yageo.com/documents/recent/PYu-RC_Group_51_RoHS_L_9.pdf?src-supplier=Digi-Key; ComponentLink3Description: http://www.yageo.com/documents/recent/PYu-RC_Group_51_RoHS_L_9.pdf?src-supplier=Digi-Key; ComponentLink4URL: http://www.farnell.com/datasheets/443971.pdf?src-supplier=Element14; ComponentLink4Description: http://www.farnell.com/datasheets/443971.pdf?src-supplier=Element14; Supplier Part Number 1: 311-390GRCT-ND
R11 R15 R18 R23 R24 = CRCW0402240RFKEDC: RES 240 OHM 1% 1/16W 0402; Manufacturer: Vishay; Power Rating: 62.5mW; Temperature Coefficient: 100ppm/°C; Supplier 1: Digi-Key; Manufacturer Part Number: CRCW0402240RFKEDC; Stock 1: 85727; Pricing 1: 1=0.1, 10=0.029, 100=0.0118, 1000=0.0053, 2500=0.0046, 5000=0.0038 (USD); Mount: Surface Mount; Case/Package: SMD/SMT; Contact Plating: Tin; Min Operating Temperature: -55°C; Max Operating Temperature: 155°C; Resistance: 240R; Tolerance: 1%; Resistor Type: Thick Film; Termination: Wraparound; Length: 1mm; Lead Free: Lead Free; Supplier Part Number 1: 541-3997-6-ND
R12 R19 R20 R25 R26 = RK73B1ETTP103J: RES 10K OHM 5% 1/10W 0402; Manufacturer: KOA Speer; Resistance: 10kR; Power Rating: 63mW; Voltage Rating: 50V; Temperature Coefficient: 200ppm/°C; Supplier 1: Digi-Key; Manufacturer Part Number: RK73B1ETTP103J; Stock 1: 2917894; Pricing 1: 1=0.1, 10=0.016, 100=0.0065, 1000=0.00292, 2500=0.00253, 5000=0.00209 (USD); Mount: Surface Mount; Case/Package: 0402; Case Code (Imperial): 0402; Case Code (Metric): 1005; Min Operating Temperature: -55°C; Max Operating Temperature: 155°C; Packaging: Tape and Reel; Tolerance: 5%; Package Quantity: 10000; Composition: Thick Film; Termination: SMD/SMT; Military Standard: Not; Voltage Rating (DC): 50V; Length: 1mm; Height: 0.35mm; Width: 0.5mm; Depth: 0.5mm; Lead Free: Lead Free; ComponentLink1URL: https://www.verical.com/server-webapp/html/getDatasheet?partID=89073&src-supplier=Verical; ComponentLink1Description: https://www.verical.com/server-webapp/html/getDatasheet?partID=89073&src-supplier=Verical; Supplier Part Number 1: 2019-RK73B1ETTP103JCT-ND
R38 R46 R48 R50 = RC0402FR-074K7L: RES SMD 4.7K OHM 1% 1/16W 0402; Manufacturer: Yageo; Voltage Rating (DC): 50V; Power Rating: 62.5mW; Resistance: 4.7kR; Temperature Coefficient: 100ppm/°C; Supplier 1: Digi-Key; Manufacturer Part Number 1: RC0402FR-074K7L; Stock 1: 26143098; Pricing 1: 1=0.1, 10=0.016, 100=0.0067, 1000=0.003, 2500=0.0026, 5000=0.0022 (USD); Case/Package: 0402; Number of Pins: 2; Case Code (Imperial): 0402; Case Code (Metric): 1005; Min Operating Temperature: -55°C; Max Operating Temperature: 155°C; Tolerance: 1%; Voltage Rating: 50V; Packaging: Tape and Reel; Composition: Thick Film; Termination: SMD/SMT; Military Standard: Not; Length: 1mm; Height: 0.32mm; Width: 0.5mm; Depth: 0.5mm; REACH SVHC: No SVHC; Lead Free: Lead Free; ComponentLink1URL: http://www.farnell.com/datasheets/1018594.pdf?src-supplier=Element14; ComponentLink1Description: http://www.farnell.com/datasheets/1018594.pdf?src-supplier=Element14; ComponentLink2URL: https://www.verical.com/server-webapp/html/getDatasheet?partID=328119&src-supplier=Verical; ComponentLink2Description: https://www.verical.com/server-webapp/html/getDatasheet?partID=328119&src-supplier=Verical; ComponentLink3URL: http://www.farnell.com/datasheets/1686128.pdf?src-supplier=Element14; ComponentLink3Description: http://www.farnell.com/datasheets/1686128.pdf?src-supplier=Element14; Supplier Part Number 1: 311-4.7KLRCT-ND
R120-R123 = RC0402FR-0710KL: as R90 on sheet LED's Section_2; Supplier 1: Digi-Key; Manufacturer Part Number: RC0402FR-0710KL; Stock 1: 98435877; Pricing 1: 1=0.1, 10=0.016, 100=0.0067, 1000=0.00301, 2500=0.00261, 5000=0.00215 (USD); Mount: Surface Mount; Case/Package: 0402; Number of Pins: 2; Min Operating Temperature: -55°C; Max Operating Temperature: 155°C; Tolerance: 1%; Packaging: Cut Tape; Length: 1mm; Height: 0.32mm; Width: 500um; Depth: 0.5mm; REACH SVHC: No SVHC; Lead Free: Lead Free; Supplier Part Number 1: 311-10.0KLRCT-ND
U5-U9 = PS2801C-1-F3-A: TransistorOptocouplers DC 1 2500Vrms SOP-4_P1.27 Optocouplers RoHS; Manufacturer: CEL; Number of Channels: 1; Collector Emitter Voltage (VCEO): 300mV; Forward Voltage: 1.2V; Max Power Dissipation: 120mW; Max Collector Current: 30mA; Max Output Voltage: 80V; Supplier 1: Digi-Key; Manufacturer Part Number: PS2801C-1-F3-A; Stock 1: 399; Pricing 1: 1=0.77, 10=0.595, 100=0.3825 (USD); Mount: Surface Mount; Case/Package: SOIC; Number of Pins: 4; Min Operating Temperature: -55°C; Max Operating Temperature: 100°C; Packaging: Tape and Reel; Collector Emitter Saturation Voltage: 300mV; Package Quantity: 1; Output Current per Channel: 30mA; Lead Free: Lead Free; ComponentLink1URL: http://www.cel.com/pdf/datasheets/PS2801C-1,PS2801C-4.pdf?src-supplier=Digi-Key; ComponentLink1Description: http://www.cel.com/pdf/datasheets/PS2801C-1,PS2801C-4.pdf?src-supplier=Digi-Key; ComponentLink2URL: http://www.cel.com/pdf/datasheets/how_to_order_optos.pdf?src-supplier=Digi-Key; ComponentLink2Description: http://www.cel.com/pdf/datasheets/how_to_order_optos.pdf?src-supplier=Digi-Key; ComponentLink3URL: http://datasheet.iiic.cc/cel/PS2801C-1-F3-A.pdf?src-supplier=IIIC; ComponentLink3Description: http://datasheet.iiic.cc/cel/PS2801C-1-F3-A.pdf?src-supplier=IIIC; Supplier Part Number 1: PS2801C-1-F3-ACT-ND

## Nets that join several sheets
5V: Power Section (5 pins), LED's Section_1 (20 pins), LED's Section_2 (20 pins), USB Section (D1.A)
12V_IN: Top Sheet (J7.1), Power Section (7 pins), Connector Section (6 pins)
GND: Top Sheet (J5.1), Power Section (26 pins), Controller Section (17 pins), LED's Section_1 (41 pins), LED's Section_2 (41 pins), USB Section (12 pins), Connector Section (19 pins)
M_VDD: Top Sheet (J1.1), Power Section (C25.2 FB1.2 R3.2), Controller Section (14 pins), Connector Section (Q73.3 Q74.3 Q75.3 Q76.3)
MCU_5V: Top Sheet (J4.1), Power Section (5 pins), USB Section (D1.K D2.K)
VBUS: Top Sheet (J2.1), USB Section (5 pins)
VCC_3V3: Top Sheet (J3.1), Power Section (7 pins), LED's Section_1 (10 pins), LED's Section_2 (10 pins)
DM: Controller Section (U4.32), USB Section (C34.1 R16.1)
DP: Controller Section (U4.33), USB Section (C35.1 R17.1)
GPIOH0_O: Controller Section (U4.11), Connector Section (Q73.2 R38.2)
GPIOH1_O: Controller Section (U4.12), Connector Section (Q74.2 R46.2)
GPIOH2_O: Controller Section (U4.13), Connector Section (Q75.2 R48.2)
GPIOH3_O: Controller Section (U4.14), Connector Section (Q76.2 R50.2)
GPIOY0_O: Controller Section (U4.10), Connector Section (R5.2)
GPIOY1_O: Controller Section (U4.15), Connector Section (R13.2)
GPIOY2_O: Controller Section (U4.16), Connector Section (R14.2)
GPIOY3_O: Controller Section (U4.18), Connector Section (R22.2)
GPIOY4_O: Controller Section (U4.19), Connector Section (R21.2)
LED_GPIO_11: Controller Section (U4.30), LED's Section_1 (Q17.1 Q21.1 R63.1)
LED_GPIO_12: Controller Section (U4.31), LED's Section_1 (Q18.1 Q22.1 R64.1)
LED_GPIO_13: Controller Section (U4.34), LED's Section_1 (Q19.1 Q23.1 R65.1)
LED_GPIO_14: Controller Section (U4.22), LED's Section_1 (Q20.1 Q24.1 R66.1)
LED_GPIO_15: Controller Section (U4.38), LED's Section_1 (Q29.1 Q33.1 R75.1)
LED_GPIO_21: Controller Section (U4.25), LED's Section_1 (Q30.1 Q34.1 R76.1)
LED_GPIO_22: Controller Section (U4.26), LED's Section_1 (Q31.1 Q35.1 R77.1)
LED_GPIO_23: Controller Section (U4.27), LED's Section_1 (Q32.1 Q36.1 R78.1)
LED_GPIO_24: Controller Section (U4.20), LED's Section_1 (Q39.1 Q41.1 R85.1)
LED_GPIO_25: Controller Section (U4.37), LED's Section_1 (Q40.1 Q42.1 R86.1)
LED_GPIO_31: Controller Section (U4.45), LED's Section_2 (Q47.1 Q51.1 R94.1)
LED_GPIO_32: Controller Section (U4.39), LED's Section_2 (Q48.1 Q52.1 R95.1)
LED_GPIO_33: Controller Section (U4.40), LED's Section_2 (Q49.1 Q53.1 R96.1)
LED_GPIO_34: Controller Section (U4.46), LED's Section_2 (Q50.1 Q54.1 R97.1)
LED_GPIO_35: Controller Section (U4.21), LED's Section_2 (Q59.1 Q63.1 R106.1)
LED_GPIO_41: Controller Section (U4.42), LED's Section_2 (Q60.1 Q64.1 R107.1)
LED_GPIO_42: Controller Section (U4.43), LED's Section_2 (Q61.1 Q65.1 R108.1)
LED_GPIO_43: Controller Section (U4.41), LED's Section_2 (Q62.1 Q66.1 R109.1)
LED_GPIO_44: Controller Section (U4.17), LED's Section_2 (Q69.1 Q71.1 R116.1)
LED_GPIO_45: Controller Section (U4.29), LED's Section_2 (Q70.1 Q72.1 R117.1)